# Altium project PowerPanel.PrjPcb (part 2 of 2)

## Sheet PowerPanel_4_MCU_USB.SchDoc
size 594 x 420 mm; SheetNumber: 5; SheetTotal: 6
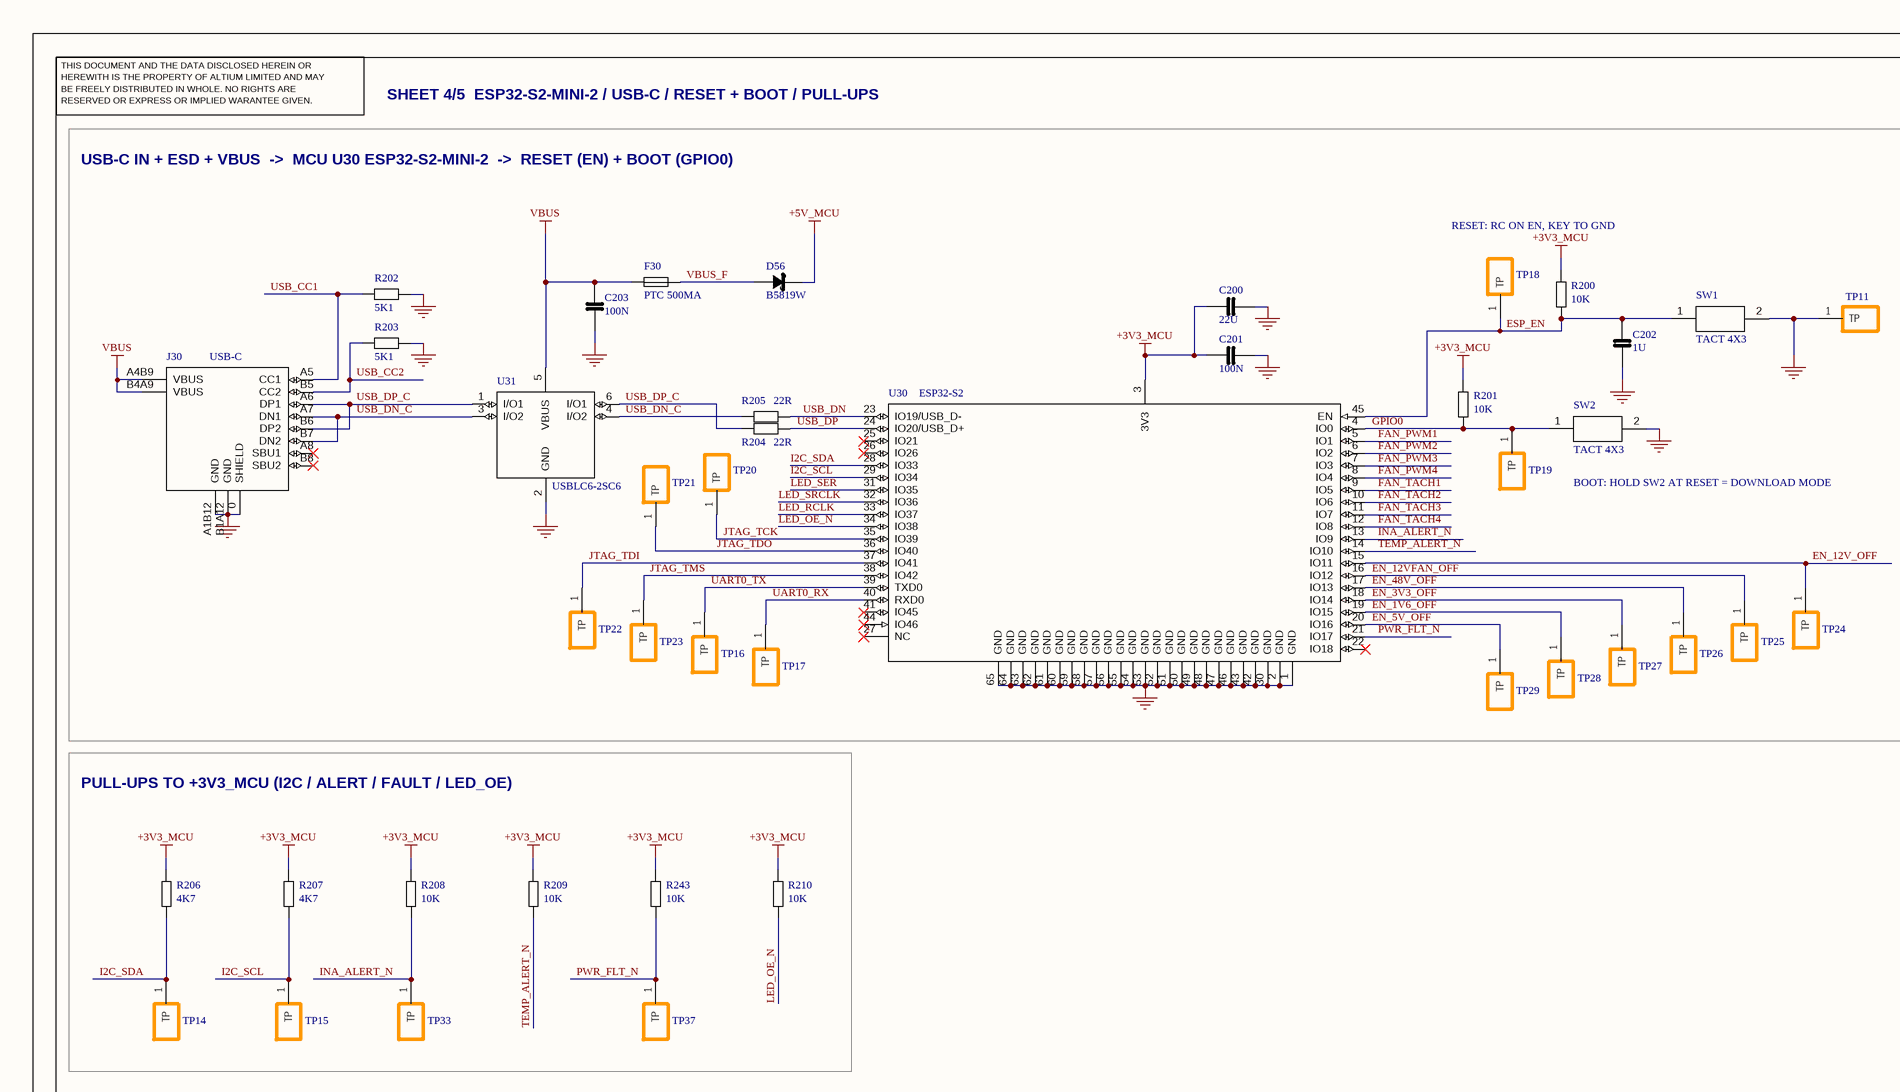
[diagram p15: PowerPanel_4_MCU_USB.SchDoc, top left]
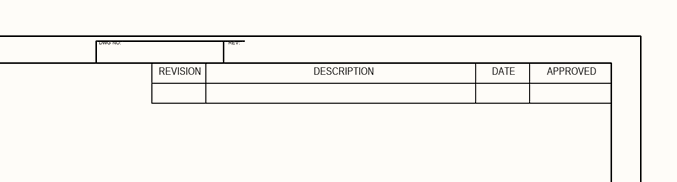
[diagram p16: PowerPanel_4_MCU_USB.SchDoc, top right]
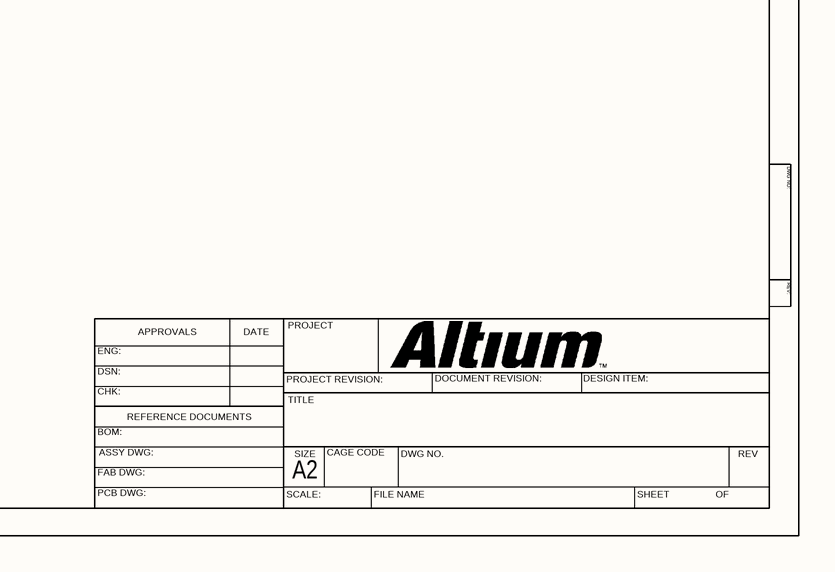
[diagram p17: PowerPanel_4_MCU_USB.SchDoc, bottom right]

### Parts
C200  22U  [CAP0805]
C201  100N  [CAP0603]
C202  1U  [CAP0603]
C203  100N  [CAP0603]
D56  B5819W  [SOD-123]
F30  PTC 500MA  [FUSE1206]
J30  USB-C  [USB-C_TYPE-C-16P-QTWT]
R200  10K  [R0603]
R201  10K  [R0603]
R202  5K1  [R0603]
R203  5K1  [R0603]
R204  22R  [R0603]
R205  22R  [R0603]
R206  4K7  [R0603]
R207  4K7  [R0603]
R208  10K  [R0603]
R209  10K  [R0603]
R210  10K  [R0603]
R243  10K  [R0603]
SW1  TACT 4X3  [SW_TS-1088]
SW2  TACT 4X3  [SW_TS-1088]
TP11  TP  [TESTPOINT]  (value not drawn)
TP14  TP  [TESTPOINT]  (value not drawn)
TP15  TP  [TESTPOINT]  (value not drawn)
TP16  TP  [TESTPOINT]  (value not drawn)
TP17  TP  [TESTPOINT]  (value not drawn)
TP18  TP  [TESTPOINT]  (value not drawn)
TP19  TP  [TESTPOINT]  (value not drawn)
TP20  TP  [TESTPOINT]  (value not drawn)
TP21  TP  [TESTPOINT]  (value not drawn)
TP22  TP  [TESTPOINT]  (value not drawn)
TP23  TP  [TESTPOINT]  (value not drawn)
TP24  TP  [TESTPOINT]  (value not drawn)
TP25  TP  [TESTPOINT]  (value not drawn)
TP26  TP  [TESTPOINT]  (value not drawn)
TP27  TP  [TESTPOINT]  (value not drawn)
TP28  TP  [TESTPOINT]  (value not drawn)
TP29  TP  [TESTPOINT]  (value not drawn)
TP33  TP  [TESTPOINT]  (value not drawn)
TP37  TP  [TESTPOINT]  (value not drawn)
U30  ESP32-S2  [MOD_ESP32-S2-MINI-2]
U31  USBLC6-2SC6  [SOT-23-6]

### Blocks framed on the sheet
PULL-UPS TO +3V3_MCU (I2C / ALERT / FAULT / LED_OE): R206-R210 R243 TP14 TP15 TP33 TP37

### Nets
+3V3_MCU: C200.1 C201.1 R200.1 R201.1 R206.1 R207.1 R208.1 R209.1 R210.1 R243.1 U30.3(3V3)
+5V_MCU: D56.1(K)
GND: C200.2 C201.2 C202.2 C203.2 J30.0(SHIELD) J30.A1B12(GND) J30.B1A12(GND) R202.2 R203.2 SW1.2 SW2.2 TP11.1(TP) U30.1(GND) U30.2(GND) U30.30(GND) U30.42(GND) U30.43(GND) U30.46(GND) U30.47(GND) U30.48(GND) U30.49(GND) U30.50(GND) U30.51(GND) U30.52(GND) U30.53(GND) U30.54(GND) U30.55(GND) U30.56(GND) U30.57(GND) U30.58(GND) U30.59(GND) U30.60(GND) U30.61(GND) U30.62(GND) U30.63(GND) U30.64(GND) U30.65(GND) U31.2(GND)
VBUS: C203.1 F30.1 J30.A4B9(VBUS) J30.B4A9(VBUS) U31.5(VBUS)
EN_1V6_OFF: TP28.1(TP) U30.19(IO15)
EN_3V3_OFF: TP27.1(TP) U30.18(IO14)
EN_5V_OFF: TP29.1(TP) U30.20(IO16)
EN_12V_OFF: TP24.1(TP) U30.15(IO11)
EN_12VFAN_OFF: TP25.1(TP) U30.16(IO12)
EN_48V_OFF: TP26.1(TP) U30.17(IO13)
ESP_EN: C202.1 R200.2 SW1.1 TP18.1(TP) U30.45(EN)
FAN_PWM1: U30.5(IO1)
FAN_PWM2: U30.6(IO2)
FAN_PWM3: U30.7(IO3)
FAN_PWM4: U30.8(IO4)
FAN_TACH1: U30.9(IO5)
FAN_TACH2: U30.10(IO6)
FAN_TACH3: U30.11(IO7)
FAN_TACH4: U30.12(IO8)
GPIO0: R201.2 SW2.1 TP19.1(TP) U30.4(IO0)
I2C_SCL: R207.2 TP15.1(TP) U30.29(IO34)
I2C_SDA: R206.2 TP14.1(TP) U30.28(IO33)
INA_ALERT_N: R208.2 TP33.1(TP) U30.13(IO9)
JTAG_TCK: TP20.1(TP) U30.35(IO39)
JTAG_TDI: TP22.1(TP) U30.37(IO41)
JTAG_TDO: TP21.1(TP) U30.36(IO40)
JTAG_TMS: TP23.1(TP) U30.38(IO42)
LED_OE_N: R210.2 U30.34(IO38)
LED_RCLK: U30.33(IO37)
LED_SER: U30.31(IO35)
LED_SRCLK: U30.32(IO36)
PWR_FLT_N: R243.2 TP37.1(TP) U30.21(IO17)
TEMP_ALERT_N: R209.2 U30.14(IO10)
UART0_RX: TP17.1(TP) U30.40(RXD0)
UART0_TX: TP16.1(TP) U30.39(TXD0)
USB_CC1: J30.A5(CC1) R202.1
USB_CC2: J30.B5(CC2) R203.1
USB_DN: R205.2 U30.23(IO19/USB_D-)
USB_DN_C: J30.A7(DN1) J30.B7(DN2) R205.1 U31.3(I/O2) U31.4(I/O2)
USB_DP: R204.2 U30.24(IO20/USB_D+)
USB_DP_C: J30.A6(DP1) J30.B6(DP2) R204.1 U31.1(I/O1) U31.6(I/O1)
VBUS_F: D56.2(A) F30.2

Not connected (* = marked no-connect by the designer): J30 A8(SBU1)* B8(SBU2)*; U30 22(IO18)* 25(IO21)* 26(IO26)* 27(NC)* 41(IO45)* 44(IO46)*

### Notes on the sheet
- DWG NO:
- REV:
- THIS DOCUMENT AND THE DATA DISCLOSED HEREIN OR
- HEREWITH IS THE PROPERTY OF ALTIUM LIMITED AND MAY
- BE FREELY DISTRIBUTED IN WHOLE. NO RIGHTS ARE
- RESERVED OR EXPRESS OR IMPLIED WARANTEE GIVEN.
- SHEET 4/5  ESP32-S2-MINI-2 / USB-C / RESET + BOOT / PULL-UPS
- REVISION
- DESCRIPTION
- DATE
- APPROVED
- USB-C IN + ESD + VBUS  ->  MCU U30 ESP32-S2-MINI-2  ->  RESET (EN) + BOOT (GPIO0)
- RESET: RC ON EN, KEY TO GND
- BOOT: HOLD SW2 AT RESET = DOWNLOAD MODE
- ENG:
- APPROVALS
- PROJECT
- DSN:
- CHK:
- REFERENCE DOCUMENTS
- PROJECT REVISION:
- TITLE
- DOCUMENT REVISION:
- DESIGN ITEM:
- BOM:
- FAB DWG:
- PCB DWG:
- ASSY DWG:
- SCALE:
- A2
- SIZE
- CAGE CODE
- FILE NAME
- DWG NO.
- SHEET
- OF
- REV

### Library data of the parts
C200 = C_22U_0805: CAP // 22U // 25V // X5R // 0805; MFR: Samsung Electro-Mechanics; MPN: CL21A226MAQNNNE; Value: 22U; LCSC: C45783; JLC_TYPE: BASIC; JLC_CHECKED: 2026-09-29 STOCK 4065880; Datasheet: https://www.lcsc.com/datasheet/lcsc_datasheet_2304140030_Samsung-Electro-Mechanics-CL21A226MAQNNNE_C45783.pdf
C201 C203 = C_100N_0603: CAP // 100N // 50V // X7R // 0603; MFR: YAGEO; MPN: CC0603KRX7R9BB104; Value: 100N; LCSC: C14663; JLC_TYPE: BASIC; JLC_CHECKED: 2026-09-29 STOCK 55887132; Datasheet: https://www.lcsc.com/datasheet/lcsc_datasheet_2211101700_YAGEO-CC0603KRX7R9BB104_C14663.pdf
C202 = C_1U_0603: CAP // 1U // 50V // X5R // 0603; MFR: Samsung Electro-Mechanics; MPN: CL10A105KB8NNNC; Value: 1U; LCSC: C15849; JLC_TYPE: BASIC; JLC_CHECKED: 2026-09-29 STOCK 6435528; Datasheet: https://www.lcsc.com/datasheet/lcsc_datasheet_2304140030_Samsung-Electro-Mechanics-CL10A105KB8NNNC_C15849.pdf
D56 = D_B5819W: SCHOTTKY // 40V 1A // 600MV // SOD-123; MFR: Jiangsu Changjing Electronics Technology Co., Ltd.; MPN: B5819W SL; Value: B5819W; LCSC: C8598; JLC_TYPE: BASIC; JLC_CHECKED: 2026-09-29 STOCK 545116; Datasheet: https://www.lcsc.com/datasheet/lcsc_datasheet_2304140030_Jiangsu-Changjing-Electronics-Technology-Co---Ltd--B5819W-SL_C8598.pdf
F30 = F_PTC_500MA_1206: PTC FUSE // 500MA HOLD // 1A TRIP // 30V // 1206; MFR: BHFUSE; MPN: BSMD1206-050-30V; Value: 500MA; LCSC: C883126; JLC_TYPE: EXTENDED; JLC_CHECKED: 2026-09-29 STOCK 92778; Datasheet: https://www.lcsc.com/datasheet/lcsc_datasheet_2305121423_BHFUSE-BSMD1206-050-30V_C883126.pdf
J30 = J_USBC_16P_QTWT: CONN // USB-C RECEPT // USB2.0 16P // 3A 5V // SMD RA; MFR: SHOU HAN; MPN: TYPE-C 16P QTWT; Value: 16P; LCSC: C5187472; JLC_TYPE: EXTENDED; JLC_CHECKED: 2026-10-03 STOCK 77988; Datasheet: https://wmsc.lcsc.com/wmsc/upload/file/pdf/v2/lcsc/2209291730_SHOU-HAN-TYPE-C-16P-QTWT_C5187472.pdf
R200 R201 R208-R210 R243 = R_10K_0603: RES // 10K // 1% // 100MW // 0603; MFR: UNI-ROYAL(Uniroyal Elec); MPN: 0603WAF1002T5E; Value: 10K; LCSC: C25804; JLC_TYPE: BASIC; JLC_CHECKED: 2026-09-29 STOCK 21309815; Datasheet: https://www.lcsc.com/datasheet/lcsc_datasheet_2206010045_UNI-ROYAL-Uniroyal-Elec-0603WAF1002T5E_C25804.pdf
R202 R203 = R_5K1_0603: RES // 5K1 // 1% // 100MW // 0603; MFR: UNI-ROYAL(Uniroyal Elec); MPN: 0603WAF5101T5E; Value: 5K1; LCSC: C23186; JLC_TYPE: BASIC; JLC_CHECKED: 2026-09-29 STOCK 25577365; Datasheet: https://www.lcsc.com/datasheet/lcsc_datasheet_2206010116_UNI-ROYAL-Uniroyal-Elec-0603WAF5101T5E_C23186.pdf
R204 R205 = R_22R_0603: RES // 22R // 1% // 100MW // 0603; MFR: UNI-ROYAL(Uniroyal Elec); MPN: 0603WAF220JT5E; Value: 22R; LCSC: C23345; JLC_TYPE: BASIC; JLC_CHECKED: 2026-09-29 STOCK 9242496; Datasheet: https://www.lcsc.com/datasheet/lcsc_datasheet_2206010100_UNI-ROYAL-Uniroyal-Elec-0603WAF220JT5E_C23345.pdf
R206 R207 = R_4K7_0603: RES // 4K7 // 1% // 100MW // 0603; MFR: UNI-ROYAL(Uniroyal Elec); MPN: 0603WAF4701T5E; Value: 4K7; LCSC: C23162; JLC_TYPE: BASIC; JLC_CHECKED: 2026-09-29 STOCK 22752027; Datasheet: https://www.lcsc.com/datasheet/lcsc_datasheet_2206010116_UNI-ROYAL-Uniroyal-Elec-0603WAF4701T5E_C23162.pdf
SW1 SW2 = SW_TACT_4X3: SW // TACT SPST // 160GF // 50MA 12V // SMD 3.9X3.0; MFR: XUNPU; MPN: TS-1088-AR02016; Value: SPST; LCSC: C720477; JLC_TYPE: BASIC; JLC_CHECKED: 2026-09-29 STOCK 884099; Datasheet: https://www.lcsc.com/datasheet/lcsc_datasheet_2304140030_XUNPU-TS-1088-AR02016_C720477.pdf
TP11 TP14-TP29 TP33 TP37 = TP: TP // SMD PAD // 1.5MM; MPN: TEST POINT (NOT A BOM PART)
U30 = U_ESP32-S2-MINI-2-N4: MODULE // ESP32-S2 // WIFI4 // 4MB FLASH // PCB ANT // LGA-65 15.4X20.5; MFR: Espressif Systems; Value: ESP32-S2-MINI-2-N4; MPN: ESP32-S2-MINI-2-N4; LCSC: C3013906; JLC_TYPE: EXTENDED; JLC_CHECKED: 2026-10-03 STOCK 2429; Datasheet: https://wmsc.lcsc.com/wmsc/upload/file/pdf/v2/lcsc/2208151830_Espressif-Systems-ESP32-S2-MINI-2-N4_C3013906.pdf
U31 = U_USBLC6-2SC6: ESD // USB2 // 2CH // SOT-23-6; MFR: UMW(Youtai Semiconductor Co., Ltd.); Value: USBLC6-2SC6; MPN: USBLC6-2SC6; LCSC: C2687116; JLC_TYPE: EXTENDED; JLC_CHECKED: 2026-09-29 STOCK 79878; Datasheet: https://www.lcsc.com/datasheet/lcsc_datasheet_2311091738_UMW-Youtai-Semiconductor-Co---Ltd--USBLC6-2SC6_C2687116.pdf

## Sheet PowerPanel_5_Fans_LEDs_IO.SchDoc
size 594 x 420 mm; SheetNumber: 6; SheetTotal: 6
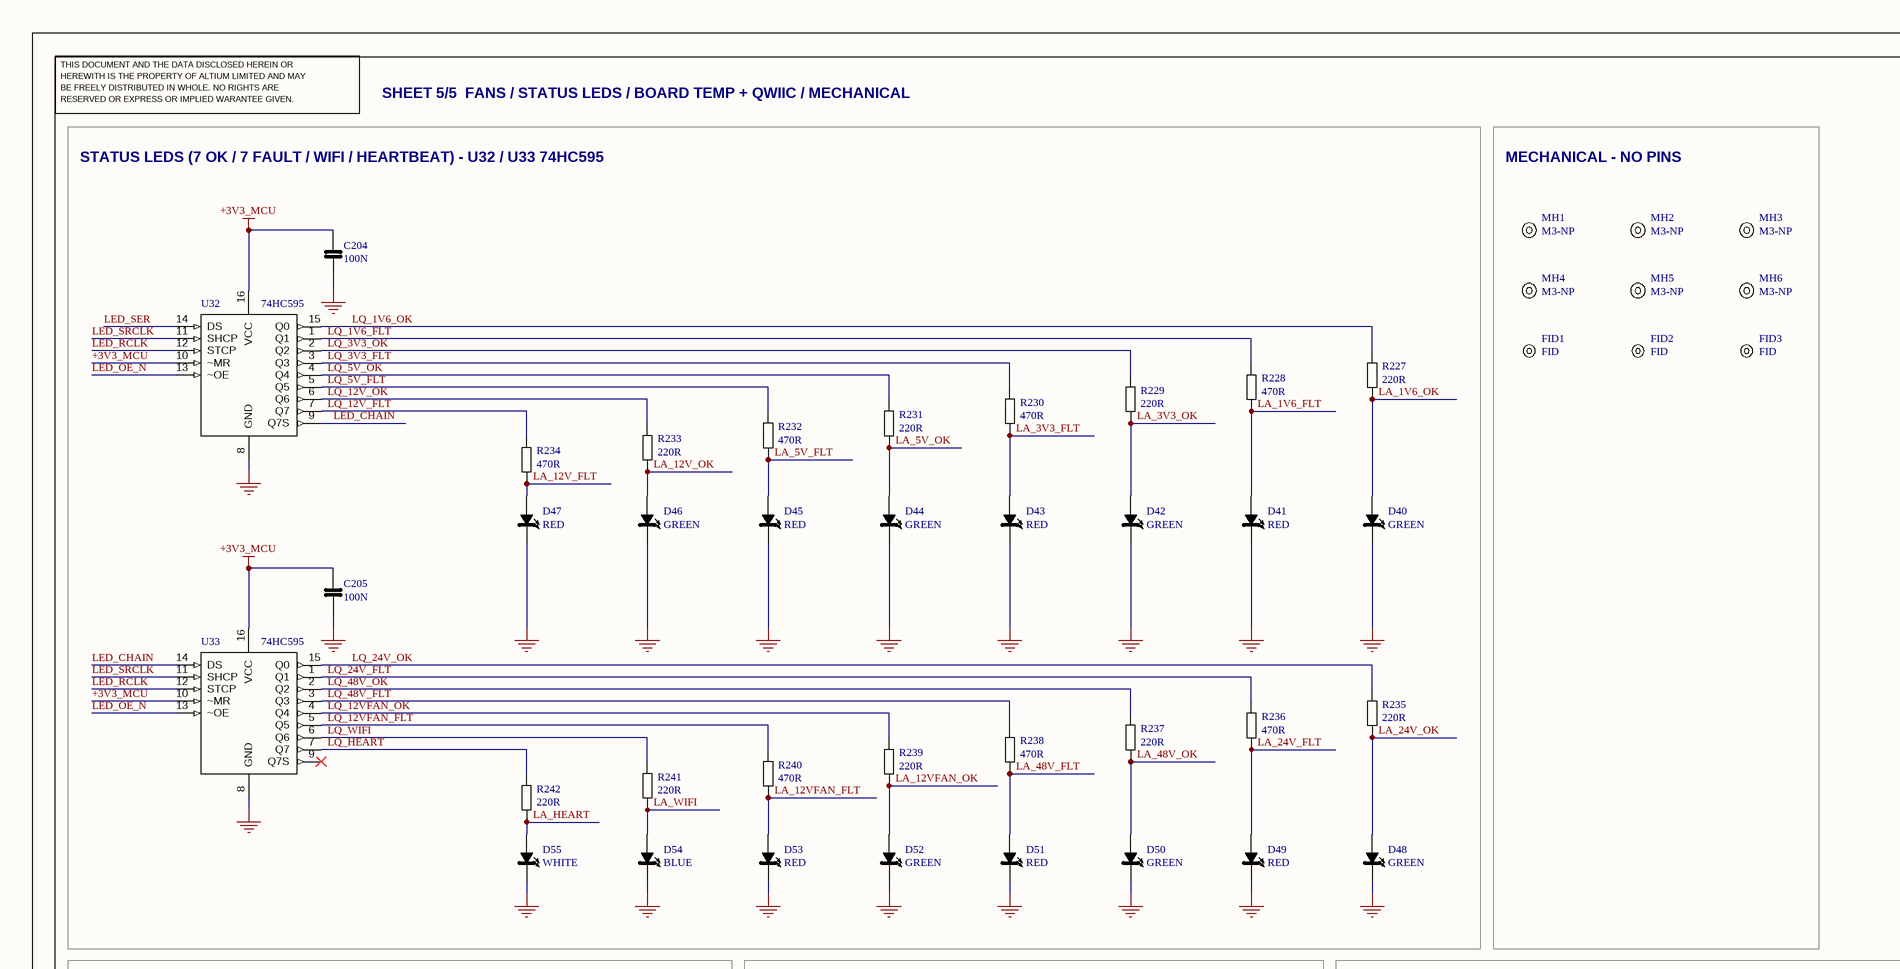
[diagram p18: PowerPanel_5_Fans_LEDs_IO.SchDoc, top left]
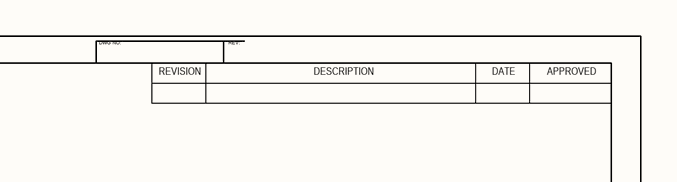
[diagram p19: PowerPanel_5_Fans_LEDs_IO.SchDoc, top right]
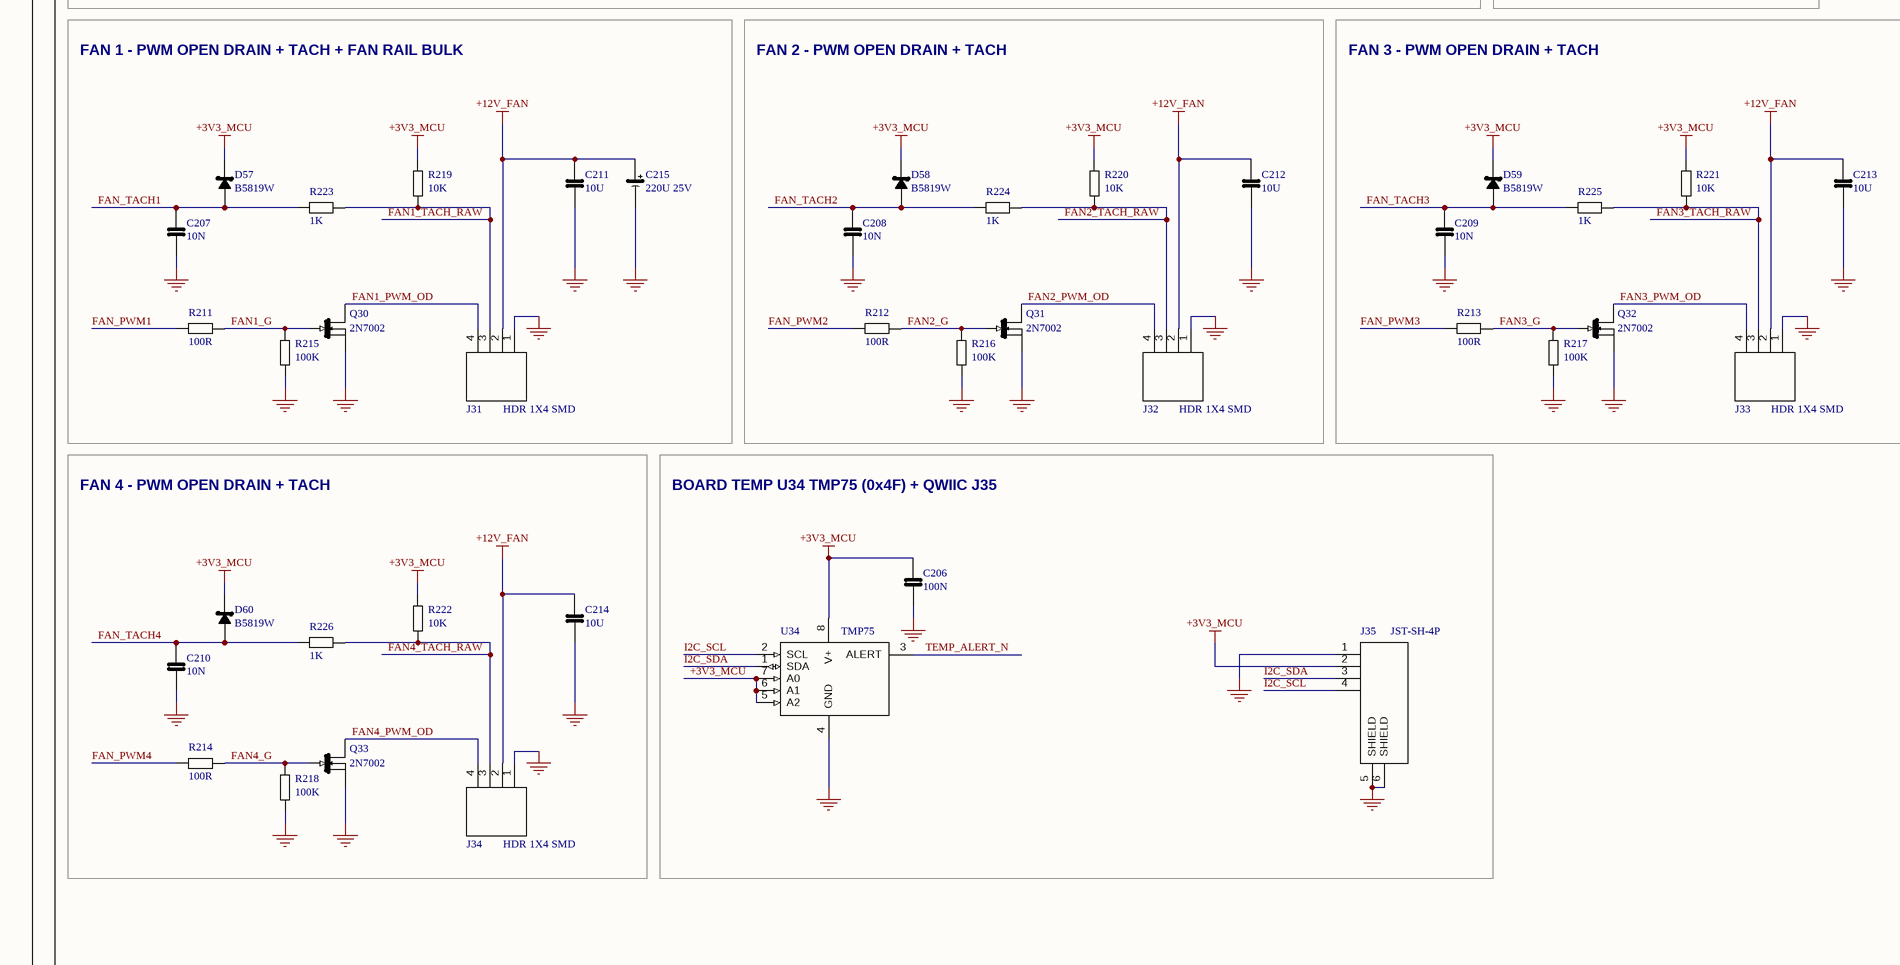
[diagram p20: PowerPanel_5_Fans_LEDs_IO.SchDoc, bottom left]
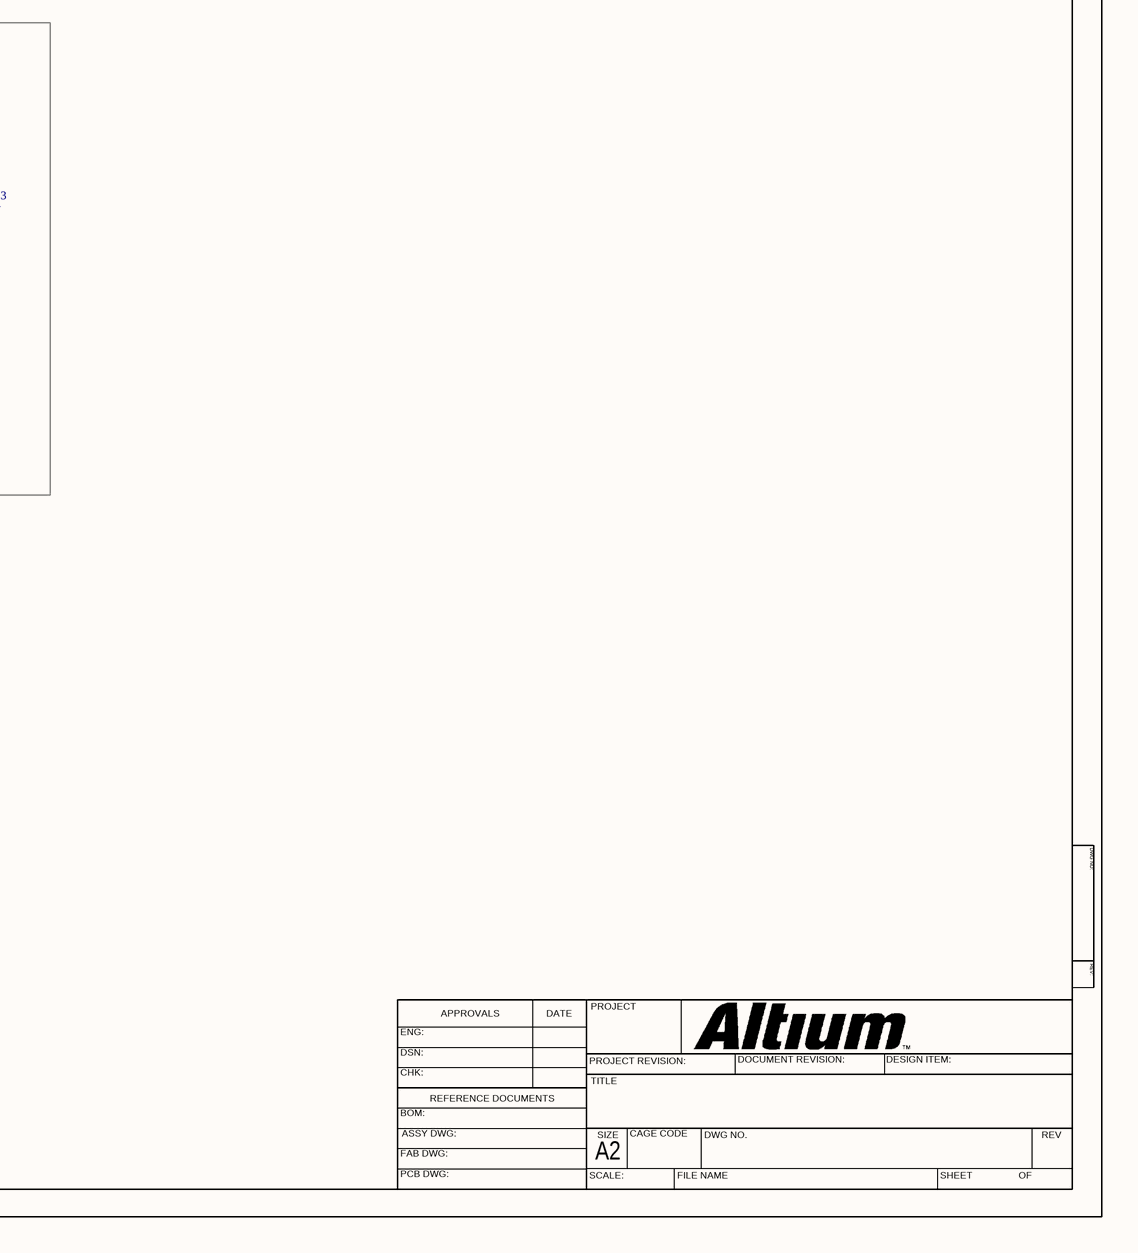
[diagram p21: PowerPanel_5_Fans_LEDs_IO.SchDoc, bottom right]

### Parts
C204  100N  [CAP0603]
C205  100N  [CAP0603]
C206  100N  [CAP0603]
C207  10N  [CAP0603]
C208  10N  [CAP0603]
C209  10N  [CAP0603]
C210  10N  [CAP0603]
C211  10U  [CAP0805]
C212  10U  [CAP0805]
C213  10U  [CAP0805]
C214  10U  [CAP0805]
C215  220U 25V  [CAPAE_D6.3X7.7]
D40  GREEN  [LED0603]
D41  RED  [LED0603]
D42  GREEN  [LED0603]
D43  RED  [LED0603]
D44  GREEN  [LED0603]
D45  RED  [LED0603]
D46  GREEN  [LED0603]
D47  RED  [LED0603]
D48  GREEN  [LED0603]
D49  RED  [LED0603]
D50  GREEN  [LED0603]
D51  RED  [LED0603]
D52  GREEN  [LED0603]
D53  RED  [LED0603]
D54  BLUE  [LED0603]
D55  WHITE  [LED0603]
D57  B5819W  [SOD-123]
D58  B5819W  [SOD-123]
D59  B5819W  [SOD-123]
D60  B5819W  [SOD-123]
FID1  FID  [FIDUCIAL_1MM]
FID2  FID  [FIDUCIAL_1MM]
FID3  FID  [FIDUCIAL_1MM]
J31  HDR 1X4 SMD  [HDR_1X04_M_2.54_SMD_STAG]
J32  HDR 1X4 SMD  [HDR_1X04_M_2.54_SMD_STAG]
J33  HDR 1X4 SMD  [HDR_1X04_M_2.54_SMD_STAG]
J34  HDR 1X4 SMD  [HDR_1X04_M_2.54_SMD_STAG]
J35  JST-SH-4P  [JST_SM04B-SRSS-TB]
MH1  M3-NP  [MH-M3-NP]
MH2  M3-NP  [MH-M3-NP]
MH3  M3-NP  [MH-M3-NP]
MH4  M3-NP  [MH-M3-NP]
MH5  M3-NP  [MH-M3-NP]
MH6  M3-NP  [MH-M3-NP]
Q30  2N7002  [SOT-23-3]
Q31  2N7002  [SOT-23-3]
Q32  2N7002  [SOT-23-3]
Q33  2N7002  [SOT-23-3]
R211  100R  [R0603]
R212  100R  [R0603]
R213  100R  [R0603]
R214  100R  [R0603]
R215  100K  [R0603]
R216  100K  [R0603]
R217  100K  [R0603]
R218  100K  [R0603]
R219  10K  [R0603]
R220  10K  [R0603]
R221  10K  [R0603]
R222  10K  [R0603]
R223  1K  [R0603]
R224  1K  [R0603]
R225  1K  [R0603]
R226  1K  [R0603]
R227  220R  [R0603]
R228  470R  [R0603]
R229  220R  [R0603]
R230  470R  [R0603]
R231  220R  [R0603]
R232  470R  [R0603]
R233  220R  [R0603]
R234  470R  [R0603]
R235  220R  [R0603]
R236  470R  [R0603]
R237  220R  [R0603]
R238  470R  [R0603]
R239  220R  [R0603]
R240  470R  [R0603]
R241  220R  [R0603]
R242  220R  [R0603]
U32  74HC595  [SOIC-16]
U33  74HC595  [SOIC-16]
U34  TMP75  [SOIC-8]

### Blocks framed on the sheet
MECHANICAL - NO PINS: FID1-FID3 MH1-MH6
FAN 1 - PWM OPEN DRAIN + TACH + FAN RAIL BULK: C207 C211 C215 D57 J31 Q30 R211 R215 R219 R223
FAN 2 - PWM OPEN DRAIN + TACH: C208 C212 D58 J32 Q31 R212 R216 R220 R224
FAN 3 - PWM OPEN DRAIN + TACH: C209 C213 D59 J33 Q32 R213 R217 R221 R225
FAN 4 - PWM OPEN DRAIN + TACH: C210 C214 D60 J34 Q33 R214 R218 R222 R226
BOARD TEMP U34 TMP75 (0x4F) + QWIIC J35: C206 J35 U34

### Nets
+3V3_MCU: C204.1 C205.1 C206.1 D57.1(K) D58.1(K) D59.1(K) D60.1(K) J35.2 R219.1 R220.1 R221.1 R222.1 U32.10(~MR) U32.16(VCC) U33.10(~MR) U33.16(VCC) U34.5(A2) U34.6(A1) U34.7(A0) U34.8(V+)
+12V_FAN: C211.1 C212.1 C213.1 C214.1 C215.1(+) J31.2 J32.2 J33.2 J34.2
GND: C204.2 C205.2 C206.2 C207.2 C208.2 C209.2 C210.2 C211.2 C212.2 C213.2 C214.2 C215.2(-) D40.1(K) D41.1(K) D42.1(K) D43.1(K) D44.1(K) D45.1(K) D46.1(K) D47.1(K) D48.1(K) D49.1(K) D50.1(K) D51.1(K) D52.1(K) D53.1(K) D54.1(K) D55.1(K) J31.1 J32.1 J33.1 J34.1 J35.1 J35.5(SHIELD) J35.6(SHIELD) Q30.2(S) Q31.2(S) Q32.2(S) Q33.2(S) R215.2 R216.2 R217.2 R218.2 U32.8(GND) U33.8(GND) U34.4(GND)
FAN1_G: Q30.1(G) R211.2 R215.1
FAN1_PWM_OD: J31.4 Q30.3(D)
FAN1_TACH_RAW: J31.3 R219.2 R223.1
FAN2_G: Q31.1(G) R212.2 R216.1
FAN2_PWM_OD: J32.4 Q31.3(D)
FAN2_TACH_RAW: J32.3 R220.2 R224.1
FAN3_G: Q32.1(G) R213.2 R217.1
FAN3_PWM_OD: J33.4 Q32.3(D)
FAN3_TACH_RAW: J33.3 R221.2 R225.1
FAN4_G: Q33.1(G) R214.2 R218.1
FAN4_PWM_OD: J34.4 Q33.3(D)
FAN4_TACH_RAW: J34.3 R222.2 R226.1
FAN_PWM1: R211.1
FAN_PWM2: R212.1
FAN_PWM3: R213.1
FAN_PWM4: R214.1
FAN_TACH1: C207.1 D57.2(A) R223.2
FAN_TACH2: C208.1 D58.2(A) R224.2
FAN_TACH3: C209.1 D59.2(A) R225.2
FAN_TACH4: C210.1 D60.2(A) R226.2
I2C_SCL: J35.4 U34.2(SCL)
I2C_SDA: J35.3 U34.1(SDA)
LA_1V6_FLT: D41.2(A) R228.2
LA_1V6_OK: D40.2(A) R227.2
LA_3V3_FLT: D43.2(A) R230.2
LA_3V3_OK: D42.2(A) R229.2
LA_5V_FLT: D45.2(A) R232.2
LA_5V_OK: D44.2(A) R231.2
LA_12V_FLT: D47.2(A) R234.2
LA_12V_OK: D46.2(A) R233.2
LA_12VFAN_FLT: D53.2(A) R240.2
LA_12VFAN_OK: D52.2(A) R239.2
LA_24V_FLT: D49.2(A) R236.2
LA_24V_OK: D48.2(A) R235.2
LA_48V_FLT: D51.2(A) R238.2
LA_48V_OK: D50.2(A) R237.2
LA_HEART: D55.2(A) R242.2
LA_WIFI: D54.2(A) R241.2
LED_CHAIN: U32.9(Q7S) U33.14(DS)
LED_OE_N: U32.13(~OE) U33.13(~OE)
LED_RCLK: U32.12(STCP) U33.12(STCP)
LED_SER: U32.14(DS)
LED_SRCLK: U32.11(SHCP) U33.11(SHCP)
LQ_1V6_FLT: R228.1 U32.1(Q1)
LQ_1V6_OK: R227.1 U32.15(Q0)
LQ_3V3_FLT: R230.1 U32.3(Q3)
LQ_3V3_OK: R229.1 U32.2(Q2)
LQ_5V_FLT: R232.1 U32.5(Q5)
LQ_5V_OK: R231.1 U32.4(Q4)
LQ_12V_FLT: R234.1 U32.7(Q7)
LQ_12V_OK: R233.1 U32.6(Q6)
LQ_12VFAN_FLT: R240.1 U33.5(Q5)
LQ_12VFAN_OK: R239.1 U33.4(Q4)
LQ_24V_FLT: R236.1 U33.1(Q1)
LQ_24V_OK: R235.1 U33.15(Q0)
LQ_48V_FLT: R238.1 U33.3(Q3)
LQ_48V_OK: R237.1 U33.2(Q2)
LQ_HEART: R242.1 U33.7(Q7)
LQ_WIFI: R241.1 U33.6(Q6)
TEMP_ALERT_N: U34.3(ALERT)

Not connected (* = marked no-connect by the designer): U33 9(Q7S)*

### Notes on the sheet
- DWG NO:
- REV:
- THIS DOCUMENT AND THE DATA DISCLOSED HEREIN OR
- HEREWITH IS THE PROPERTY OF ALTIUM LIMITED AND MAY
- BE FREELY DISTRIBUTED IN WHOLE. NO RIGHTS ARE
- RESERVED OR EXPRESS OR IMPLIED WARANTEE GIVEN.
- SHEET 5/5  FANS / STATUS LEDS / BOARD TEMP + QWIIC / MECHANICAL
- REVISION
- DESCRIPTION
- DATE
- APPROVED
- STATUS LEDS (7 OK / 7 FAULT / WIFI / HEARTBEAT) - U32 / U33 74HC595
- ENG:
- APPROVALS
- PROJECT
- DSN:
- CHK:
- REFERENCE DOCUMENTS
- PROJECT REVISION:
- TITLE
- DOCUMENT REVISION:
- DESIGN ITEM:
- BOM:
- FAB DWG:
- PCB DWG:
- ASSY DWG:
- SCALE:
- A2
- SIZE
- CAGE CODE
- FILE NAME
- DWG NO.
- SHEET
- OF
- REV

### Library data of the parts
C204-C206 = C_100N_0603: as C201 on sheet PowerPanel_4_MCU_USB; Value: 100N; LCSC: C14663; JLC_TYPE: BASIC; JLC_CHECKED: 2026-09-29 STOCK 55887132; Datasheet: https://www.lcsc.com/datasheet/lcsc_datasheet_2211101700_YAGEO-CC0603KRX7R9BB104_C14663.pdf
C207-C210 = C_10N_0603: CAP // 10N // 50V // X7R // 0603; MFR: FH (Guangdong Fenghua Advanced Tech); MPN: 0603B103K500NT; Value: 10N; LCSC: C57112; JLC_TYPE: BASIC; JLC_CHECKED: 2026-09-29 STOCK 6903861; Datasheet: https://www.lcsc.com/datasheet/lcsc_datasheet_2304140030_FH--Guangdong-Fenghua-Advanced-Tech-0603B103K500NT_C57112.pdf
C211-C214 = C_10U_0805: CAP // 10U // 25V // X5R // 0805; MFR: Samsung Electro-Mechanics; MPN: CL21A106KAYNNNE; Value: 10U; LCSC: C15850; JLC_TYPE: BASIC; JLC_CHECKED: 2026-09-29 STOCK 5145754; Datasheet: https://www.lcsc.com/datasheet/lcsc_datasheet_2304140030_Samsung-Electro-Mechanics-CL21A106KAYNNNE_C15850.pdf
C215 = CP_220U_25V_6.3X7.7: CAP ALU // 220U // 25V // 20% // 105C // SMD D6.3X7.7; MFR: jieerrui; MPN: JVJ25V220M6x8; Value: 220U; LCSC: C46550404; JLC_TYPE: EXTENDED; JLC_CHECKED: 2026-09-29 STOCK 314304; Datasheet: https://www.lcsc.com/datasheet/lcsc_datasheet_2504101957_jieerrui-JVJ16V470M6x8_C46550400.pdf
D40 D42 D44 D46 D48 D50 D52 = LED_GREEN_0603: LED // GREEN // 525NM // VF 3V3 // 0603; MFR: XINGLIGHT; MPN: XL-1608UGC-04; Value: GREEN; LCSC: C965804; JLC_TYPE: EXTENDED; JLC_CHECKED: 2026-09-29 STOCK 3738563; Datasheet: https://wmsc.lcsc.com/wmsc/upload/file/pdf/v2/lcsc/2402181505_XINGLIGHT-XL-1608UGC-04_C965804.pdf
D41 D43 D45 D47 D49 D51 D53 = LED_RED_0603: LED // RED // 615-630NM // VF 2V0 // 0603; MFR: Hubei KENTO Elec; MPN: KT-0603R; Value: RED; LCSC: C2286; JLC_TYPE: BASIC; JLC_CHECKED: 2026-09-29 STOCK 4928823; Datasheet: https://www.lcsc.com/datasheet/lcsc_datasheet_1810231112_Hubei-KENTO-Elec-KT-0603R_C2286.pdf
D54 = LED_BLUE_0603: LED // BLUE // 470NM // VF 3V3 // 0603; MFR: XINGLIGHT; MPN: XL-1608UBC-04; Value: BLUE; LCSC: C965807; JLC_TYPE: EXTENDED; JLC_CHECKED: 2026-09-29 STOCK 2281634; Datasheet: https://wmsc.lcsc.com/wmsc/upload/file/pdf/v2/lcsc/2402181505_XINGLIGHT-XL-1608UBC-04_C965807.pdf
D55 = LED_WHITE_0603: LED // WHITE // VF 2V6-3V1 // 0603; MFR: Hubei KENTO Elec; MPN: KT-0603W; Value: WHITE; LCSC: C2290; JLC_TYPE: BASIC; JLC_CHECKED: 2026-09-29 STOCK 2151535; Datasheet: https://www.lcsc.com/datasheet/lcsc_datasheet_2305091500_Hubei-KENTO-Elec-KT-0603W_C2290.pdf
D57-D60 = D_B5819W: as D56 on sheet PowerPanel_4_MCU_USB; Value: B5819W; LCSC: C8598; JLC_TYPE: BASIC; JLC_CHECKED: 2026-09-29 STOCK 545116; Datasheet: https://www.lcsc.com/datasheet/lcsc_datasheet_2304140030_Jiangsu-Changjing-Electronics-Technology-Co---Ltd--B5819W-SL_C8598.pdf
FID1-FID3 = FIDUCIAL: FID // 1.0MM // PNP REFERENCE // NOT A BOM PART; MPN: FIDUCIAL (NOT A BOM PART)
J31-J34 = J_HDR_1X04_M_2.54_SMD: CONN // HDR MALE 1X4 // 2.54MM // 3A // SMD VERT STAGGERED; MFR: HANXIA; MPN: HX PZ2.54-1x4P TP-YQ; Value: 1X4; LCSC: C41417361; JLC_TYPE: EXTENDED; JLC_CHECKED: 2026-10-03 STOCK 51826; Datasheet: https://wmsc.lcsc.com/wmsc/upload/file/pdf/v2/lcsc/2411220032_hanxia-HX-PZ2-54-1x4P-TP-YQ_C41417361.pdf
J35 = J_JST-SH_4P_SMD: CONN // JST-SH // 4P // 1.0MM // 1A 50V // SMD RA; MFR: JST; MPN: SM04B-SRSS-TB(LF)(SN); Value: 4P; LCSC: C160404; JLC_TYPE: EXTENDED; JLC_CHECKED: 2026-09-29 STOCK 37873; Datasheet: https://www.lcsc.com/datasheet/lcsc_datasheet_2304140030_JST-SM04B-SRSS-TB-LF-SN_C160404.pdf
MH1-MH6 = MH-M3-NP: MOUNT // M3 // NPTH // NO COPPER // NO PIN; MFR: HOUSE STANDARD; MPN: MH-M3-NP (NOT A BOM PART - SCREW HOLE); Value: M3
Q30-Q33 = Q_2N7002: NMOS // 60V // 115MA // 5R@10V // SOT-23; MFR: Jiangsu Changjing Electronics Technology Co., Ltd.; Value: 2N7002; MPN: 2N7002; LCSC: C8545; JLC_TYPE: BASIC; JLC_CHECKED: 2026-09-29 STOCK 1679919; Datasheet: https://www.lcsc.com/datasheet/lcsc_datasheet_2304140030_Jiangsu-Changjing-Electronics-Technology-Co---Ltd--2N7002_C8545.pdf
R211-R214 = R_100R_0603: RES // 100R // 1% // 100MW // 0603; MFR: UNI-ROYAL(Uniroyal Elec); MPN: 0603WAF1000T5E; Value: 100R; LCSC: C22775; JLC_TYPE: BASIC; JLC_CHECKED: 2026-09-29 STOCK 11791812; Datasheet: https://www.lcsc.com/datasheet/lcsc_datasheet_2411221126_UNI-ROYAL-Uniroyal-Elec-0603WAF1000T5E_C22775.pdf
R215-R218 = R_100K_0603: RES // 100K // 1% // 100MW // 0603; MFR: UNI-ROYAL(Uniroyal Elec); MPN: 0603WAF1003T5E; Value: 100K; LCSC: C25803; JLC_TYPE: BASIC; JLC_CHECKED: 2026-09-29 STOCK 22429301; Datasheet: https://www.lcsc.com/datasheet/lcsc_datasheet_2206010045_UNI-ROYAL-Uniroyal-Elec-0603WAF1003T5E_C25803.pdf
R219-R222 = R_10K_0603: as R200 on sheet PowerPanel_4_MCU_USB; Value: 10K; LCSC: C25804; JLC_TYPE: BASIC; JLC_CHECKED: 2026-09-29 STOCK 21309815; Datasheet: https://www.lcsc.com/datasheet/lcsc_datasheet_2206010045_UNI-ROYAL-Uniroyal-Elec-0603WAF1002T5E_C25804.pdf
R223-R226 = R_1K_0603: RES // 1K // 1% // 100MW // 0603; MFR: UNI-ROYAL(Uniroyal Elec); MPN: 0603WAF1001T5E; Value: 1K; LCSC: C21190; JLC_TYPE: BASIC; JLC_CHECKED: 2026-09-29 STOCK 22360355; Datasheet: https://www.lcsc.com/datasheet/lcsc_datasheet_2206010130_UNI-ROYAL-Uniroyal-Elec-0603WAF1001T5E_C21190.pdf
R227 R229 R231 R233 R235 R237 R239 R241 R242 = R_220R_0603: RES // 220R // 1% // 100MW // 0603; MFR: UNI-ROYAL(Uniroyal Elec); MPN: 0603WAF2200T5E; Value: 220R; LCSC: C22962; JLC_TYPE: BASIC; JLC_CHECKED: 2026-09-29 STOCK 1954862; Datasheet: https://www.lcsc.com/datasheet/lcsc_datasheet_2206010130_UNI-ROYAL-Uniroyal-Elec-0603WAF2200T5E_C22962.pdf
R228 R230 R232 R234 R236 R238 R240 = R_470R_0603: RES // 470R // 1% // 100MW // 0603; MFR: UNI-ROYAL(Uniroyal Elec); MPN: 0603WAF4700T5E; Value: 470R; LCSC: C23179; JLC_TYPE: BASIC; JLC_CHECKED: 2026-09-29 STOCK 6479808; Datasheet: https://www.lcsc.com/datasheet/lcsc_datasheet_2206010116_UNI-ROYAL-Uniroyal-Elec-0603WAF4700T5E_C23179.pdf
U32 U33 = U_74HC595: LOGIC // 8BIT SIPO SHIFT REG // 2V-6V // SOIC-16; MFR: Nexperia; MPN: 74HC595D,118; Value: 74HC595; LCSC: C5947; JLC_TYPE: BASIC; JLC_CHECKED: 2026-09-29 STOCK 375715; Datasheet: https://www.lcsc.com/datasheet/lcsc_datasheet_2407241044_Nexperia-74HC595D-118_C5947.pdf
U34 = U_TMP75: SENSOR // TEMP 12BIT +-1C // I2C 0X48-4F // 5V5 // SOIC-8; MFR: Texas Instruments; MPN: TMP75AIDR; Value: TMP75; LCSC: C30389; JLC_TYPE: EXTENDED; JLC_CHECKED: 2026-09-29 STOCK 17077; Datasheet: https://www.ti.com/lit/ds/symlink/tmp75.pdf

## Nets that join several sheets
+3V3_MCU: PowerPanel_1_Mains_24V_48V (5 pins), PowerPanel_3_LowV_Monitors (21 pins), PowerPanel_4_MCU_USB (11 pins), PowerPanel_5_Fans_LEDs_IO (20 pins)
+5V: PowerPanel_2_Bucks (7 pins), PowerPanel_3_LowV_Monitors (9 pins)
+5V_MCU: PowerPanel_3_LowV_Monitors (6 pins), PowerPanel_4_MCU_USB (D56.1)
+12V_FAN: PowerPanel_3_LowV_Monitors (R113.2 TP5.1 U17.8 U17.9), PowerPanel_5_Fans_LEDs_IO (9 pins)
+24V_BUS: PowerPanel_1_Mains_24V_48V (17 pins), PowerPanel_2_Bucks (36 pins)
GND: PowerPanel_1_Mains_24V_48V (61 pins), PowerPanel_2_Bucks (56 pins), PowerPanel_3_LowV_Monitors (45 pins), PowerPanel_4_MCU_USB (38 pins), PowerPanel_5_Fans_LEDs_IO (46 pins)
EN_1V6_OFF: PowerPanel_3_LowV_Monitors (Q13.1 R130.1), PowerPanel_4_MCU_USB (TP28.1 U30.19)
EN_3V3_OFF: PowerPanel_2_Bucks (Q12.1 R125.1), PowerPanel_4_MCU_USB (TP27.1 U30.18)
EN_5V_OFF: PowerPanel_3_LowV_Monitors (Q14.1 R135.1), PowerPanel_4_MCU_USB (TP29.1 U30.20)
EN_12V_OFF: PowerPanel_2_Bucks (Q10.1 R105.1), PowerPanel_4_MCU_USB (TP24.1 U30.15)
EN_12VFAN_OFF: PowerPanel_2_Bucks (Q11.1 R112.1), PowerPanel_4_MCU_USB (TP25.1 U30.16)
EN_48V_OFF: PowerPanel_1_Mains_24V_48V (Q3.1 R6.1), PowerPanel_4_MCU_USB (TP26.1 U30.17)
FAN_PWM1: PowerPanel_4_MCU_USB (U30.5), PowerPanel_5_Fans_LEDs_IO (R211.1)
FAN_PWM2: PowerPanel_4_MCU_USB (U30.6), PowerPanel_5_Fans_LEDs_IO (R212.1)
FAN_PWM3: PowerPanel_4_MCU_USB (U30.7), PowerPanel_5_Fans_LEDs_IO (R213.1)
FAN_PWM4: PowerPanel_4_MCU_USB (U30.8), PowerPanel_5_Fans_LEDs_IO (R214.1)
FAN_TACH1: PowerPanel_4_MCU_USB (U30.9), PowerPanel_5_Fans_LEDs_IO (C207.1 D57.2 R223.2)
FAN_TACH2: PowerPanel_4_MCU_USB (U30.10), PowerPanel_5_Fans_LEDs_IO (C208.1 D58.2 R224.2)
FAN_TACH3: PowerPanel_4_MCU_USB (U30.11), PowerPanel_5_Fans_LEDs_IO (C209.1 D59.2 R225.2)
FAN_TACH4: PowerPanel_4_MCU_USB (U30.12), PowerPanel_5_Fans_LEDs_IO (C210.1 D60.2 R226.2)
I2C_SCL: PowerPanel_1_Mains_24V_48V (U1.5 U3.5), PowerPanel_3_LowV_Monitors (6 pins), PowerPanel_4_MCU_USB (R207.2 TP15.1 U30.29), PowerPanel_5_Fans_LEDs_IO (J35.4 U34.2)
I2C_SDA: PowerPanel_1_Mains_24V_48V (U1.4 U3.4), PowerPanel_3_LowV_Monitors (7 pins), PowerPanel_4_MCU_USB (R206.2 TP14.1 U30.28), PowerPanel_5_Fans_LEDs_IO (J35.3 U34.1)
INA_ALERT_N: PowerPanel_1_Mains_24V_48V (U1.3 U3.3), PowerPanel_3_LowV_Monitors (5 pins), PowerPanel_4_MCU_USB (R208.2 TP33.1 U30.13)
LED_OE_N: PowerPanel_4_MCU_USB (R210.2 U30.34), PowerPanel_5_Fans_LEDs_IO (U32.13 U33.13)
LED_RCLK: PowerPanel_4_MCU_USB (U30.33), PowerPanel_5_Fans_LEDs_IO (U32.12 U33.12)
LED_SER: PowerPanel_4_MCU_USB (U30.31), PowerPanel_5_Fans_LEDs_IO (U32.14)
LED_SRCLK: PowerPanel_4_MCU_USB (U30.32), PowerPanel_5_Fans_LEDs_IO (U32.11 U33.11)
LV_3V3_PRE: PowerPanel_2_Bucks (7 pins), PowerPanel_3_LowV_Monitors (R126.1 U19.10)
LV_12V_PRE: PowerPanel_2_Bucks (6 pins), PowerPanel_3_LowV_Monitors (R106.1 U16.10)
LV_12VF_PRE: PowerPanel_2_Bucks (6 pins), PowerPanel_3_LowV_Monitors (R113.1 U17.10)
PWR_FLT_N: PowerPanel_1_Mains_24V_48V (U4.15 U5.15), PowerPanel_3_LowV_Monitors (U21.8), PowerPanel_4_MCU_USB (R243.2 TP37.1 U30.21)
TEMP_ALERT_N: PowerPanel_4_MCU_USB (R209.2 U30.14), PowerPanel_5_Fans_LEDs_IO (U34.3)